# Altium schematic sheet ADV212.SchDoc
size A2; SheetNumber: 2; SheetTotal: 8
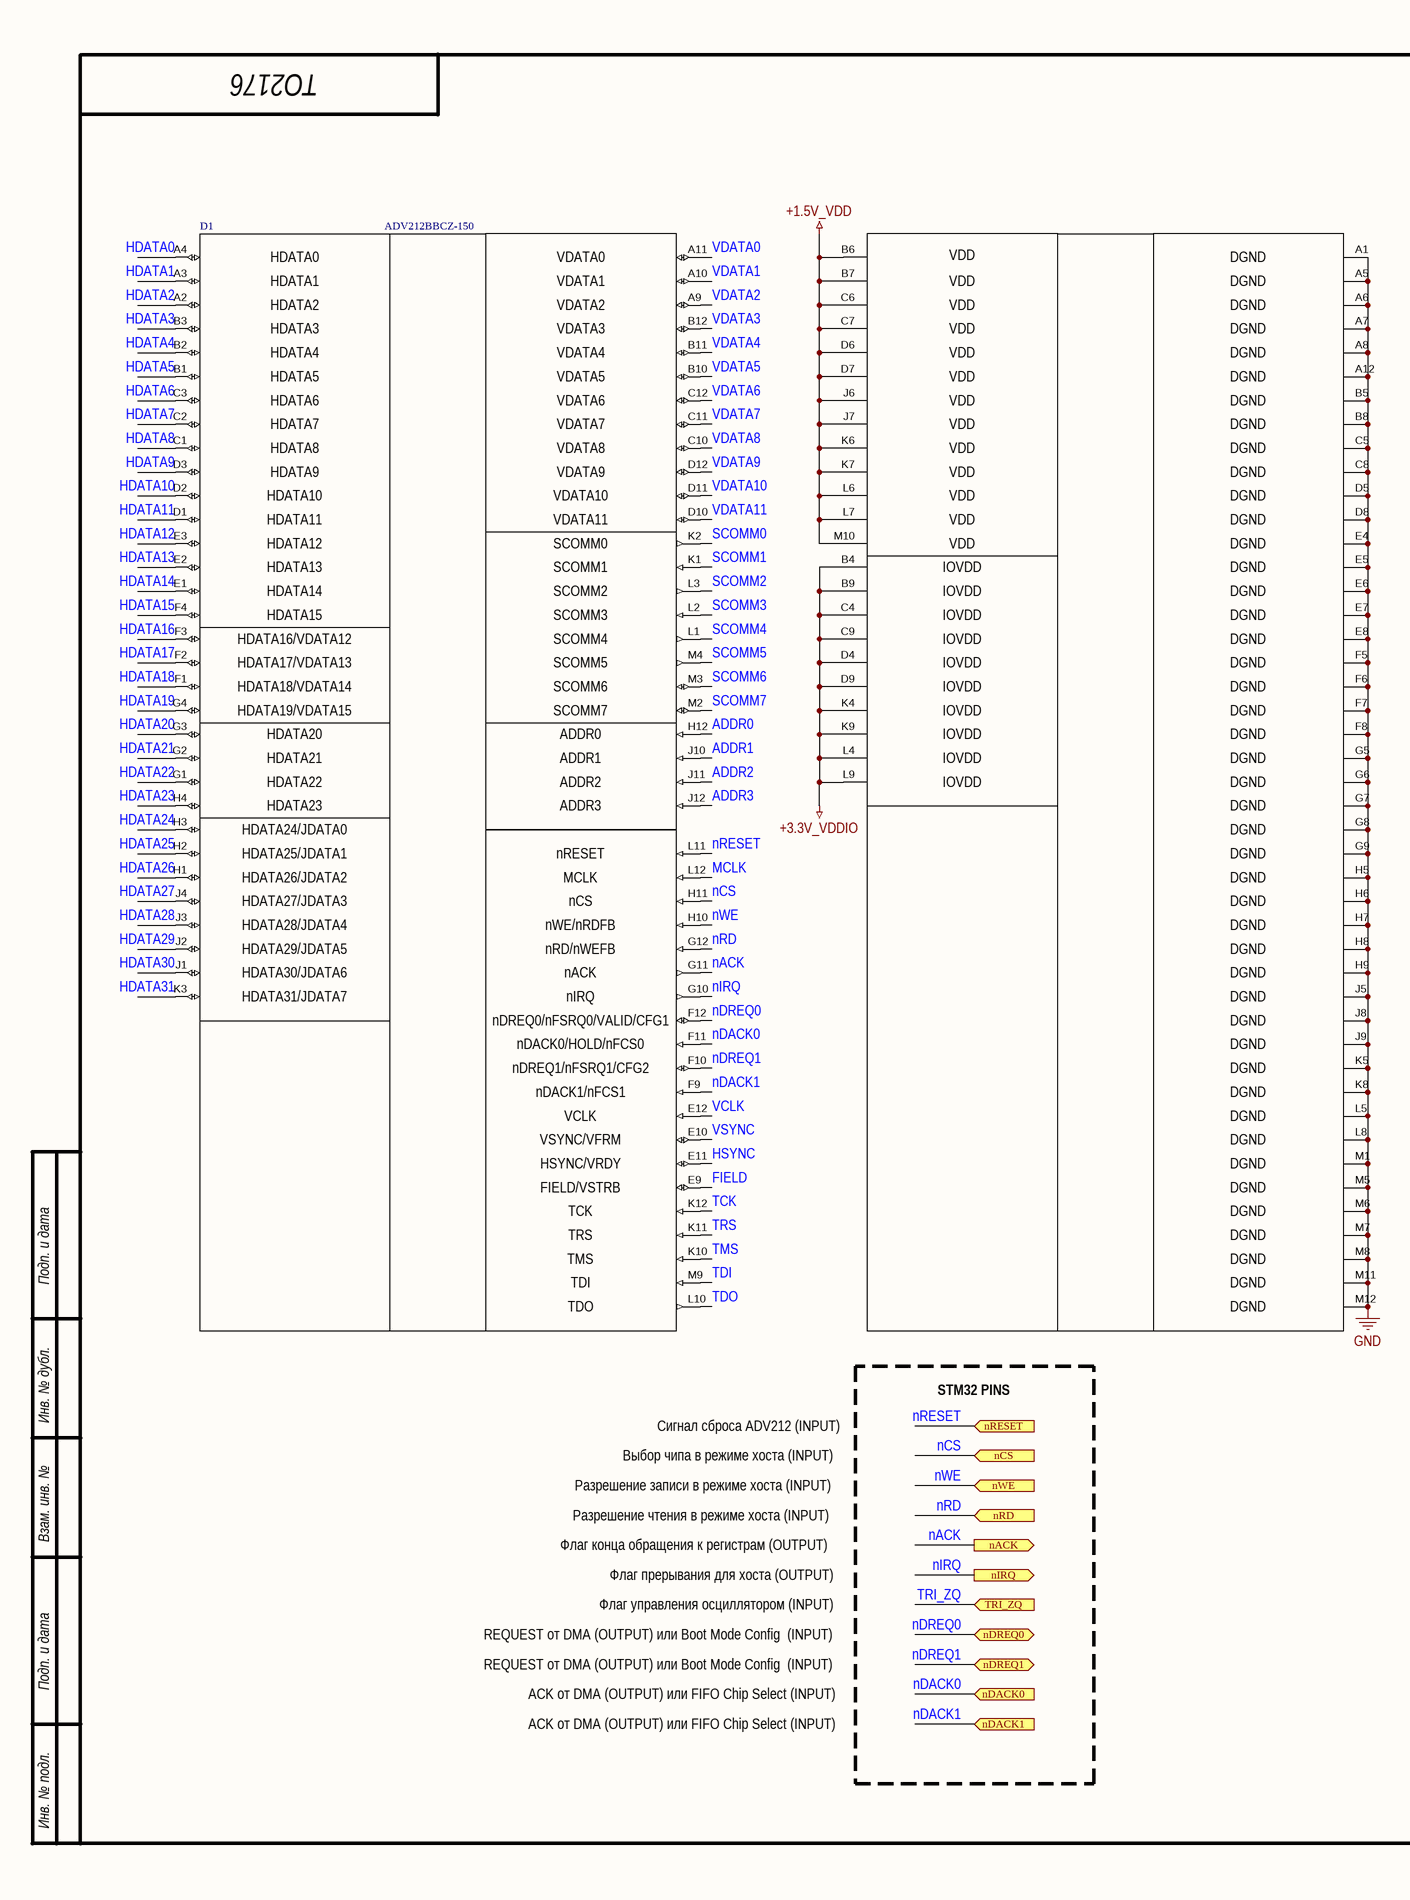
[diagram p0: ADV212.SchDoc, left]
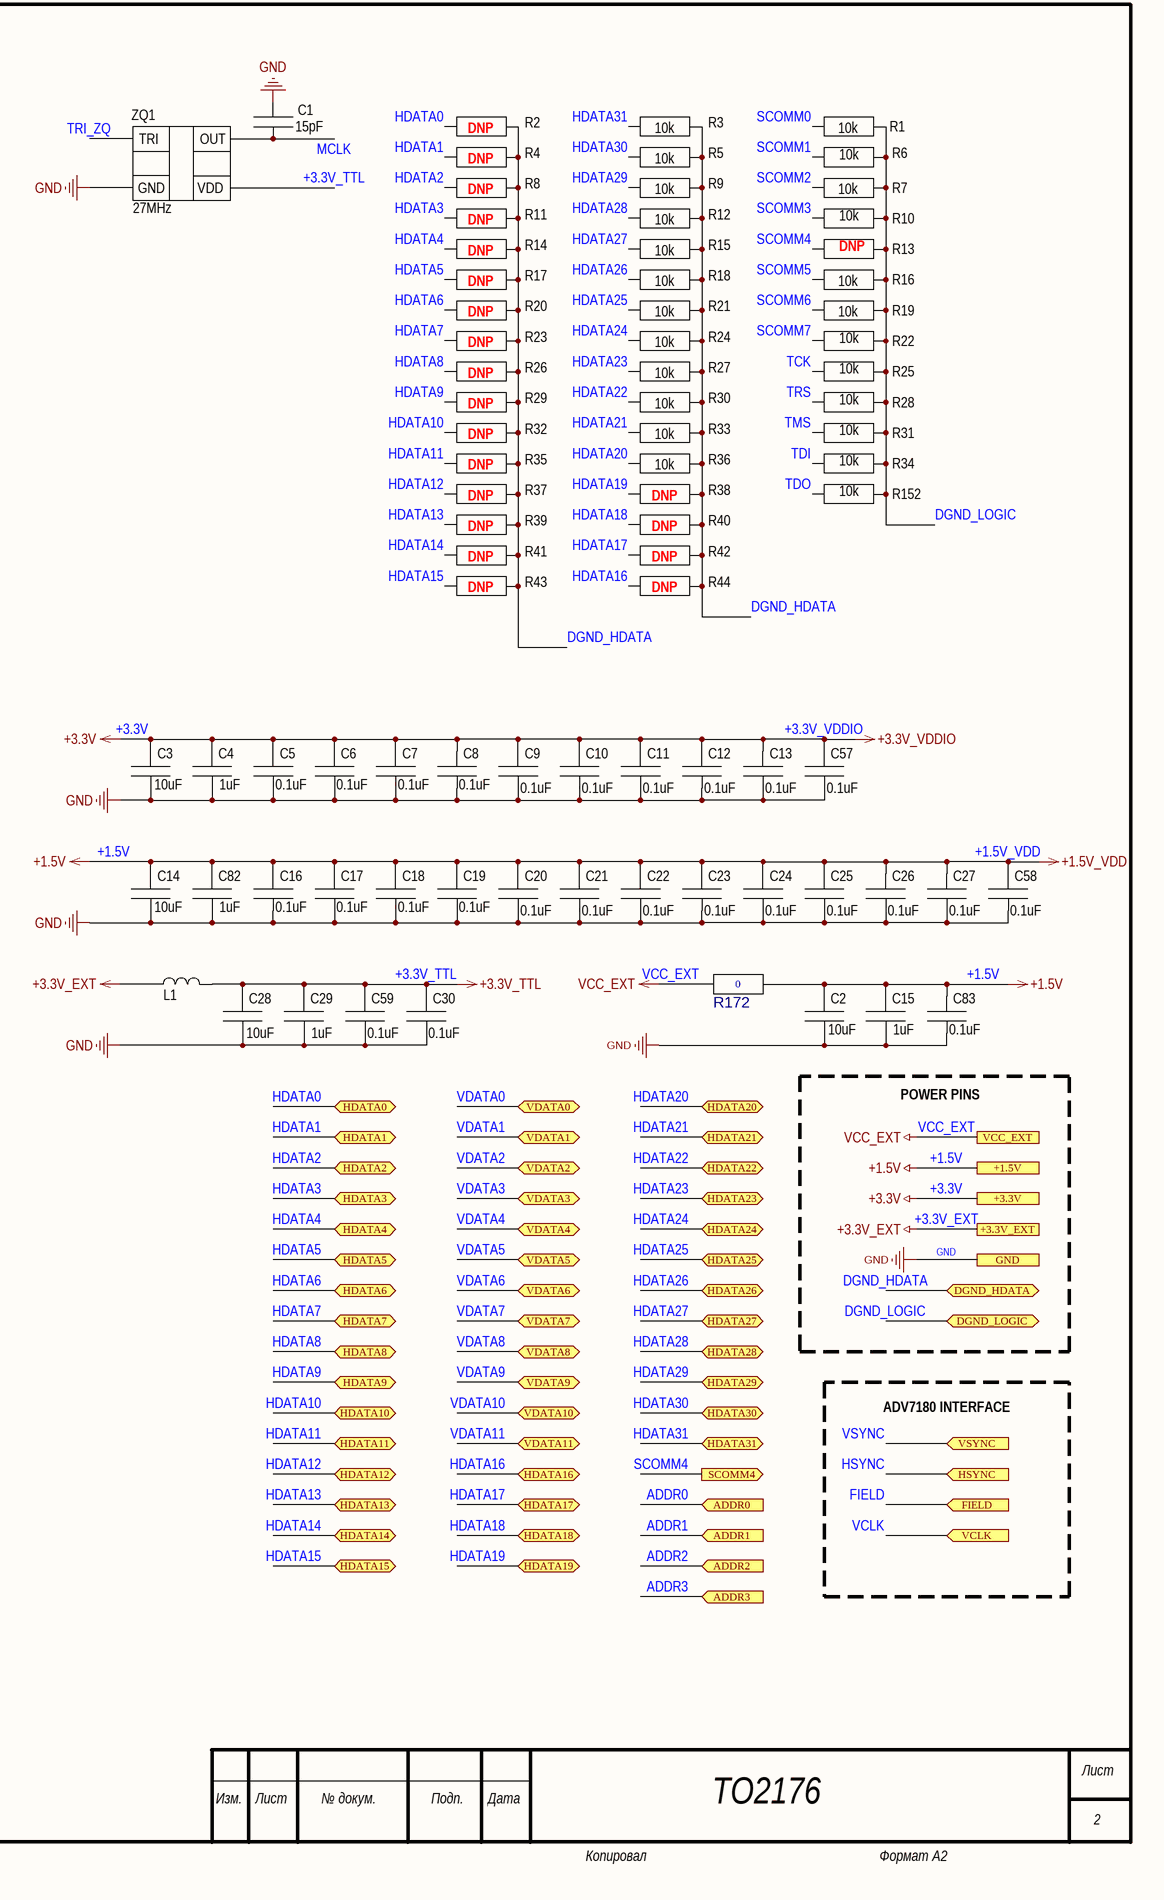
[diagram p1: ADV212.SchDoc, right]

## Parts
C1  15pF  [0603]
C2  10uF  [0603]
C3  10uF  [0603]
C4  1uF  [0603]
C5  0.1uF  [0603]
C6  0.1uF  [0603]
C7  0.1uF  [0603]
C8  0.1uF  [0603]
C9  0.1uF  [0603]
C10  0.1uF  [0603]
C11  0.1uF  [0603]
C12  0.1uF  [0603]
C13  0.1uF  [0603]
C14  10uF  [0603]
C15  1uF  [0603]
C16  0.1uF  [0603]
C17  0.1uF  [0603]
C18  0.1uF  [0603]
C19  0.1uF  [0603]
C20  0.1uF  [0603]
C21  0.1uF  [0603]
C22  0.1uF  [0603]
C23  0.1uF  [0603]
C24  0.1uF  [0603]
C25  0.1uF  [0603]
C26  0.1uF  [0603]
C27  0.1uF  [0603]
C28  10uF  [0603]
C29  1uF  [0603]
C30  0.1uF  [0603]
C57  0.1uF  [0603]
C58  0.1uF  [0603]
C59  0.1uF  [0603]
C82  1uF  [0603]
C83  0.1uF  [0603]
D1  ADV212BBCZ-150  [BGA-144 12x12]
L1  BLM18AG221SN1D (0603)  [0805]  (value not drawn)
R1  10k  [0603]
R2  DNP  [0603]
R3  10k  [0603]
R4  DNP  [0603]
R5  10k  [0603]
R6  10k  [0603]
R7  10k  [0603]
R8  DNP  [0603]
R9  10k  [0603]
R10  10k  [0603]
R11  DNP  [0603]
R12  10k  [0603]
R13  DNP  [0603]
R14  DNP  [0603]
R15  10k  [0603]
R16  10k  [0603]
R17  DNP  [0603]
R18  10k  [0603]
R19  10k  [0603]
R20  DNP  [0603]
R21  10k  [0603]
R22  10k  [0603]
R23  DNP  [0603]
R24  10k  [0603]
R25  10k  [0603]
R26  DNP  [0603]
R27  10k  [0603]
R28  10k  [0603]
R29  DNP  [0603]
R30  10k  [0603]
R31  10k  [0603]
R32  DNP  [0603]
R33  10k  [0603]
R34  10k  [0603]
R35  DNP  [0603]
R36  10k  [0603]
R37  DNP  [0603]
R38  DNP  [0603]
R39  DNP  [0603]
R40  DNP  [0603]
R41  DNP  [0603]
R42  DNP  [0603]
R43  DNP  [0603]
R44  DNP  [0603]
R152  10k  [0603]
R172  0  [0603]
ZQ1  27MHz  [SOC3 SMD]

## Ports
+1.5V, +3.3V, +3.3V_EXT, ADDR0 (in), ADDR1 (in), ADDR2 (in), ADDR3 (in), DGND_HDATA (bidir), DGND_LOGIC (bidir), FIELD (in), GND, HDATA0 (bidir), HDATA1 (bidir), HDATA2 (bidir), HDATA3 (bidir), HDATA4 (bidir), HDATA5 (bidir), HDATA6 (bidir), HDATA7 (bidir), HDATA8 (bidir), HDATA9 (bidir), HDATA10 (bidir), HDATA11 (bidir), HDATA12 (bidir), HDATA13 (bidir), HDATA14 (bidir), HDATA15 (bidir), HDATA16 (bidir), HDATA17 (bidir), HDATA18 (bidir), HDATA19 (bidir), HDATA20 (bidir), HDATA21 (bidir), HDATA22 (bidir), HDATA23 (bidir), HDATA24 (bidir), HDATA25 (bidir), HDATA26 (bidir), HDATA27 (bidir), HDATA28 (bidir), HDATA29 (bidir), HDATA30 (bidir), HDATA31 (bidir), HSYNC (in), nACK (out), nCS (in), nDACK0 (in), nDACK1 (in), nDREQ0 (bidir), nDREQ1 (bidir), nIRQ (out), nRD (in), nRESET (in), nWE (in), SCOMM4 (out), TRI_ZQ (in), VCC_EXT, VCLK (in), VDATA0 (bidir), VDATA1 (bidir), VDATA2 (bidir), VDATA3 (bidir), VDATA4 (bidir), VDATA5 (bidir), VDATA6 (bidir), VDATA7 (bidir), VDATA8 (bidir), VDATA9 (bidir), VDATA10 (bidir), VDATA11 (bidir), VSYNC (in)

## Nets
+1.5V: C2.1 C14.1 C15.1 C16.1 C17.1 C18.1 C19.1 C20.1 C21.1 C22.1 C23.1 C24.1 C25.1 C26.1 C27.1 C58.1 C82.1 C83.1 D1.B6 D1.B7 D1.C6 D1.C7 D1.D6 D1.D7 D1.J6 D1.J7 D1.K6 D1.K7 D1.L6 D1.L7 D1.M10 R172.2 ; port +1.5V  [also labelled +1.5V_VDD]
+3.3V: C3.1 C4.1 C5.1 C6.1 C7.1 C8.1 C9.1 C10.1 C11.1 C12.1 C13.1 C57.1 D1.B4 D1.B9 D1.C4 D1.C9 D1.D4 D1.D9 D1.K4 D1.K9 D1.L4 D1.L9 ; port +3.3V  [also labelled +3.3V_VDDIO]
+3.3V_EXT: L1.1 ; port +3.3V_EXT
+3.3V_TTL: C28.1 C29.1 C30.1 C59.1 L1.2 ZQ1.4
GND: C1.1 C2.2 C3.2 C4.2 C5.2 C6.2 C7.2 C8.2 C9.2 C10.2 C11.2 C12.2 C13.2 C14.2 C15.2 C16.2 C17.2 C18.2 C19.2 C20.2 C21.2 C22.2 C23.2 C24.2 C25.2 C26.2 C27.2 C28.2 C29.2 C30.2 C57.2 C58.2 C59.2 C82.2 C83.2 D1.A1 D1.A5 D1.A6 D1.A7 D1.A8 D1.A12 D1.B5 D1.B8 D1.C5 D1.C8 D1.D5 D1.D8 D1.E4 D1.E5 D1.E6 D1.E7 D1.E8 D1.F5 D1.F6 D1.F7 D1.F8 D1.G5 D1.G6 D1.G7 D1.G8 D1.G9 D1.H5 D1.H6 D1.H7 D1.H8 D1.H9 D1.J5 D1.J8 D1.J9 D1.K5 D1.K8 D1.L5 D1.L8 D1.M1 D1.M5 D1.M6 D1.M7 D1.M8 D1.M11 D1.M12 ZQ1.2 ; port GND
VCC_EXT: R172.1 ; port VCC_EXT
ADDR0: D1.H12 ; port ADDR0
ADDR1: D1.J10 ; port ADDR1
ADDR2: D1.J11 ; port ADDR2
ADDR3: D1.J12 ; port ADDR3
DGND_HDATA: R2.1 R3.1 R4.1 R5.1 R8.1 R9.1 R11.1 R12.1 R14.1 R15.1 R17.1 R18.1 R20.1 R21.1 R23.1 R24.1 R26.1 R27.1 R29.1 R30.1 R32.1 R33.1 R35.1 R36.1 R37.1 R38.1 R39.1 R40.1 R41.1 R42.1 R43.1 R44.1 ; port DGND_HDATA
DGND_LOGIC: R1.1 R6.1 R7.1 R10.1 R13.1 R16.1 R19.1 R22.1 R25.1 R28.1 R31.1 R34.1 R152.1 ; port DGND_LOGIC
FIELD: D1.E9 ; port FIELD
HDATA0: D1.A4 R2.2 ; port HDATA0
HDATA1: D1.A3 R4.2 ; port HDATA1
HDATA2: D1.A2 R8.2 ; port HDATA2
HDATA3: D1.B3 R11.2 ; port HDATA3
HDATA4: D1.B2 R14.2 ; port HDATA4
HDATA5: D1.B1 R17.2 ; port HDATA5
HDATA6: D1.C3 R20.2 ; port HDATA6
HDATA7: D1.C2 R23.2 ; port HDATA7
HDATA8: D1.C1 R26.2 ; port HDATA8
HDATA9: D1.D3 R29.2 ; port HDATA9
HDATA10: D1.D2 R32.2 ; port HDATA10
HDATA11: D1.D1 R35.2 ; port HDATA11
HDATA12: D1.E3(E) R37.2 ; port HDATA12
HDATA13: D1.E2(E) R39.2 ; port HDATA13
HDATA14: D1.E1 R41.2 ; port HDATA14
HDATA15: D1.F4 R43.2 ; port HDATA15
HDATA16: D1.F3 R44.2 ; port HDATA16
HDATA17: D1.F2 R42.2 ; port HDATA17
HDATA18: D1.F1 R40.2 ; port HDATA18
HDATA19: D1.G4 R38.2 ; port HDATA19
HDATA20: D1.G3 R36.2 ; port HDATA20
HDATA21: D1.G2 R33.2 ; port HDATA21
HDATA22: D1.G1 R30.2 ; port HDATA22
HDATA23: D1.H4 R27.2 ; port HDATA23
HDATA24: D1.H3 R24.2 ; port HDATA24
HDATA25: D1.H2 R21.2 ; port HDATA25
HDATA26: D1.H1 R18.2 ; port HDATA26
HDATA27: D1.J4 R15.2 ; port HDATA27
HDATA28: D1.J3 R12.2 ; port HDATA28
HDATA29: D1.J2 R9.2 ; port HDATA29
HDATA30: D1.J1 R5.2 ; port HDATA30
HDATA31: D1.K3 R3.2 ; port HDATA31
HSYNC: D1.E11 ; port HSYNC
MCLK: C1.2 D1.L12 ZQ1.3
nACK: D1.G11 ; port nACK
nCS: D1.H11 ; port nCS
nDACK0: D1.F11 ; port nDACK0
nDACK1: D1.F9 ; port nDACK1
nDREQ0: D1.F12 ; port nDREQ0
nDREQ1: D1.F10 ; port nDREQ1
nIRQ: D1.G10 ; port nIRQ
nRD: D1.G12 ; port nRD
nRESET: D1.L11 ; port nRESET
nWE: D1.H10 ; port nWE
SCOMM0: D1.K2 R1.2
SCOMM1: D1.K1 R6.2
SCOMM2: D1.L3 R7.2
SCOMM3: D1.L2 R10.2
SCOMM4: D1.L1 R13.2 ; port SCOMM4
SCOMM5: D1.M4 R16.2
SCOMM6: D1.M3 R19.2
SCOMM7: D1.M2 R22.2
TCK: D1.K12 R25.2
TDI: D1.M9 R34.2
TDO: D1.L10 R152.2
TMS: D1.K10 R31.2
TRI_ZQ: ZQ1.1 ; port TRI_ZQ
TRS: D1.K11 R28.2
VCLK: D1.E12 ; port VCLK
VDATA0: D1.A11 ; port VDATA0
VDATA1: D1.A10 ; port VDATA1
VDATA2: D1.A9 ; port VDATA2
VDATA3: D1.B12 ; port VDATA3
VDATA4: D1.B11 ; port VDATA4
VDATA5: D1.B10 ; port VDATA5
VDATA6: D1.C12 ; port VDATA6
VDATA7: D1.C11 ; port VDATA7
VDATA8: D1.C10 ; port VDATA8
VDATA9: D1.D12 ; port VDATA9
VDATA10: D1.D11 ; port VDATA10
VDATA11: D1.D10 ; port VDATA11
VSYNC: D1.E10 ; port VSYNC

## Notes on the sheet
- ТО2176
- POWER PINS
- Подп. и дата
- Инв. № дубл.
- Сигнал сброса ADV212 (INPUT)
- STM32 PINS
- ADV7180 INTERFACE
- Разрешение записи в режиме хоста (INPUT)
- Выбор чипа в режиме хоста (INPUT)
- Взам. инв. №
- Флаг конца обращения к регистрам (OUTPUT)
- Разрешение чтения в режиме хоста (INPUT)
- Флаг управления осциллятором (INPUT)
- Флаг прерывания для хоста (OUTPUT)
- REQUEST от DMA (OUTPUT) или Boot Mode Config  (INPUT)
- ACK от DMA (OUTPUT) или FIFO Chip Select (INPUT)
- Изм.
- Лист
- № докум.
- Подп.
- Дата
- Инв. № подл.
- Копировал
- Формат А2
- 2
- DWG NO:
- REV:
- THIS DOCUMENT AND THE DATA DISCLOSED HEREIN OR
- HEREWITH IS THE PROPERTY OF ALTIUM LIMITED AND MAY
- BE FREELY DISTRIBUTED IN WHOLE. NO RIGHTS ARE
- RESERVED OR EXPRESS OR IMPLIED WARANTEE GIVEN.
- REVISION
- DESCRIPTION
- DATE
- APPROVED
- ENG:
- APPROVALS
- PROJECT
- DSN:
- CHK:
- REFERENCE DOCUMENTS
- PROJECT REVISION:
- TITLE
- DOCUMENT REVISION:
- DESIGN ITEM:
- BOM:
- FAB DWG:
- PCB DWG:
- ASSY DWG:
- SCALE:
- A2
- SIZE
- CAGE CODE
- FILE NAME
- DWG NO.
- SHEET
- OF
- REV
- (in symbol ADV212BBCZ-150) HDATA0; VDATA0; VDD; DGND; HDATA1; VDATA1; HDATA2; VDATA2; HDATA3; VDATA3; HDATA4; VDATA4; HDATA5; VDATA5; HDATA6; VDATA6; HDATA7; VDATA7; HDATA8; VDATA8; HDATA9; VDATA9; HDATA10; VDATA10; HDATA11; VDATA11; HDATA12; SCOMM0; HDATA13; SCOMM1; IOVDD; HDATA14; SCOMM2; HDATA15; SCOMM3; HDATA16/VDATA12; SCOMM4; HDATA17/VDATA13; SCOMM5; HDATA18/VDATA14; SCOMM6; HDATA19/VDATA15; SCOMM7; HDATA20; ADDR0; HDATA21; ADDR1; HDATA22; ADDR2; HDATA23; ADDR3; HDATA24/JDATA0; HDATA25/JDATA1; nRESET; HDATA26/JDATA2; MCLK; HDATA27/JDATA3; nCS; HDATA28/JDATA4; nWE/nRDFB; HDATA29/JDATA5; nRD/nWEFB; HDATA30/JDATA6; nACK; HDATA31/JDATA7; nIRQ; nDREQ0/nFSRQ0/VALID/CFG1; nDACK0/HOLD/nFCS0; nDREQ1/nFSRQ1/CFG2; nDACK1/nFCS1; VCLK; VSYNC/VFRM; HSYNC/VRDY; FIELD/VSTRB; TCK; TRS; TMS; TDI; TDO
- (in symbol SOC3 SMD OSC) TRI; OUT; GND; VDD

## Library data of the parts
C1-C30 C57-C59 C82 C83 = C0603: ComponentHeigt: 1.3; Firme: AVX; Leadform: SMD; KIND: Конденсатор; ClassName: *; Component Link: *; ComponentWeigt: *; Packaging: 0805; NN: *; Value: *
L1 = BLM21(0805) Murata: ComponentHeigt: 1.1; Leadform: SMD; Firme: Murata; ClassName: *; Component Link: *; ComponentWeigt: *; Packaging: 1206; NN: *; KIND: *
R1-R44 R152 R172 = R0603 Yageo: ComponentHeigt: 0.5; Leadform: SMD; Firme: Yageo; Kind: Резистор; Packaging: 0402; ClassName: *; Component Link: *; NN: *
ZQ1 = SOC3 SMD OSC: TTL CMOS 3.3V 27 MHz